# Altium schematic sheet 02.C101. A41-A73. Module signals.SchDoc: Сигнальный кабель
size 209 x 297 mm; Author: Мурашкин Д.В.; Address1: Address1; Address2: Address2; Address3: Address3; Address4: Address4; DocumentNumber: ИЗДЕЛИЕ-1-2; SheetNumber: 3; Scale: 1:1; Letter1Column: Э
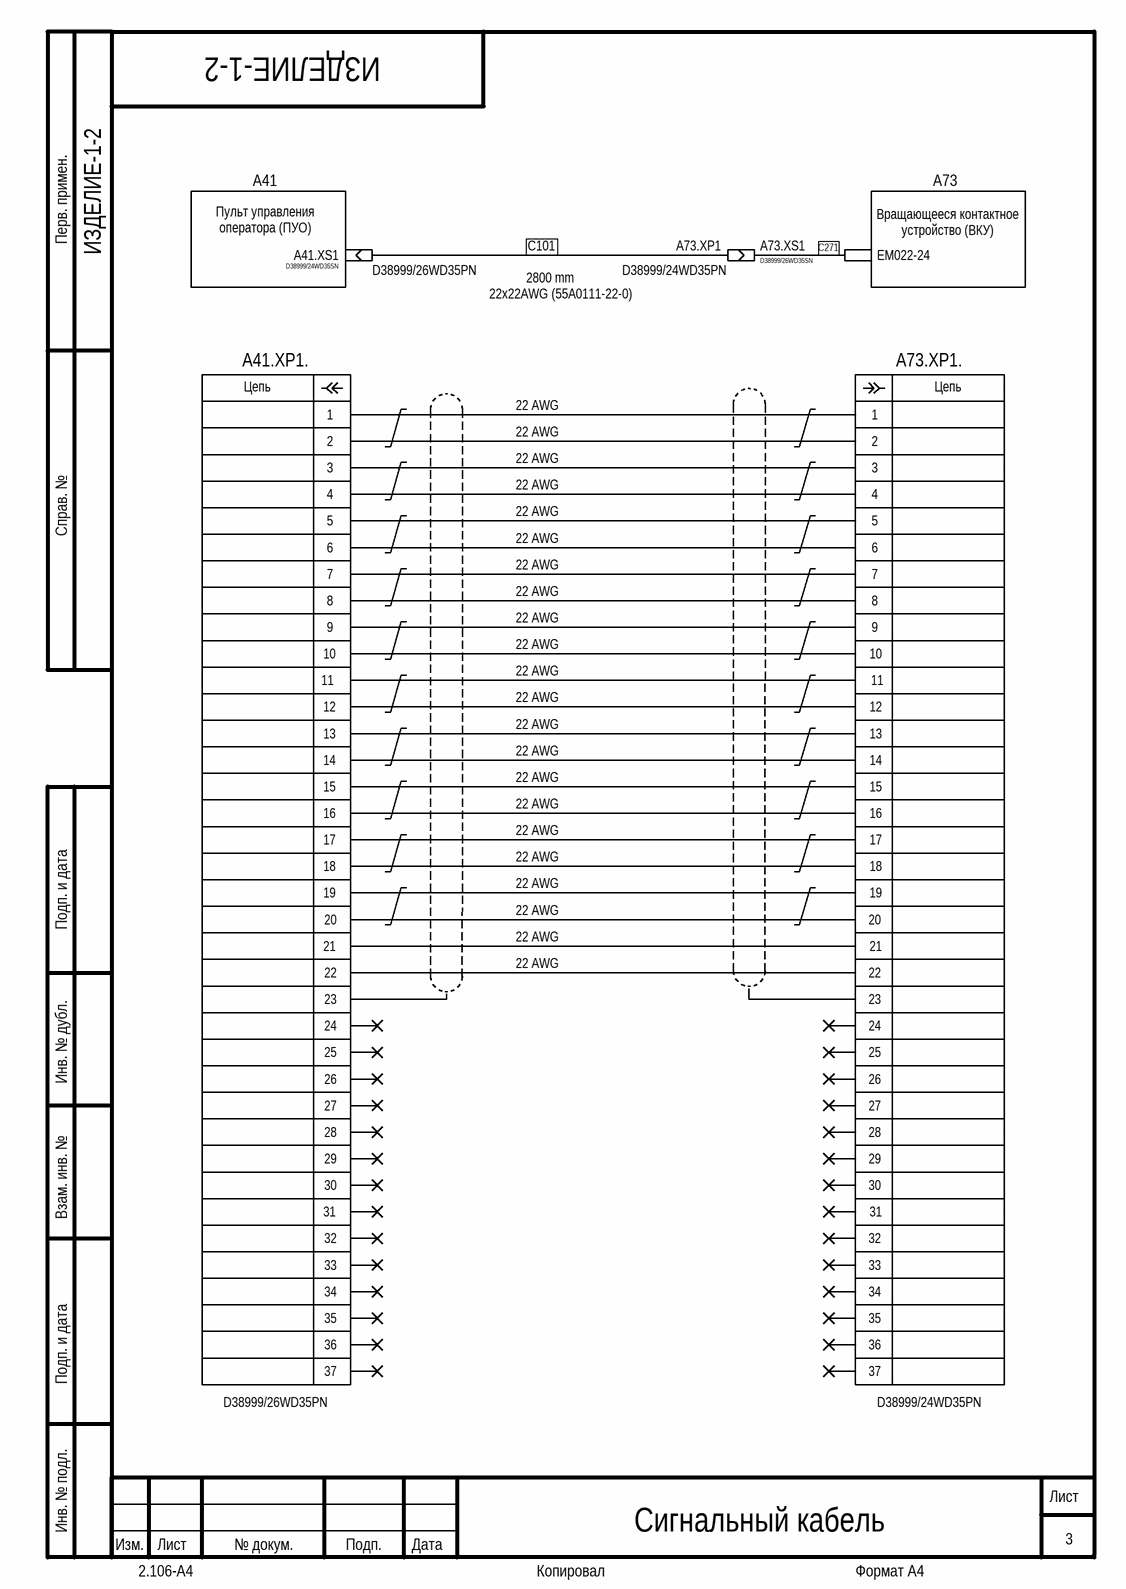
[diagram p0: 02.C101. A41-A73. Module signals.SchDoc]

## Parts
A41.XP1  D38999/26WD35PN
A41.XP1.  D38999/26WD35PN
A41.XS1  D38999/24WD35SN
A73.XP1  D38999/24WD35PN
A73.XP1.  D38999/24WD35PN
A73.XS1  D38999/26WD35SN
EM022-24  Провод  (value not drawn)  (no BOM)

## Nets
С101: A41.XP1.0 A73.XP1.0
С271: A73.XS1.0 EM022-24.0
NetA41.XP1._1: A41.XP1..1 A73.XP1..1
NetA41.XP1._2: A41.XP1..2 A73.XP1..2
NetA41.XP1._3: A41.XP1..3 A73.XP1..3
NetA41.XP1._4: A41.XP1..4 A73.XP1..4
NetA41.XP1._5: A41.XP1..5 A73.XP1..5
NetA41.XP1._6: A41.XP1..6 A73.XP1..6
NetA41.XP1._7: A41.XP1..7 A73.XP1..7
NetA41.XP1._8: A41.XP1..8 A73.XP1..8
NetA41.XP1._9: A41.XP1..9 A73.XP1..9
NetA41.XP1._10: A41.XP1..10 A73.XP1..10
NetA41.XP1._11: A41.XP1..11 A73.XP1..11
NetA41.XP1._12: A41.XP1..12 A73.XP1..12
NetA41.XP1._13: A41.XP1..13 A73.XP1..13
NetA41.XP1._14: A41.XP1..14 A73.XP1..14
NetA41.XP1._15: A41.XP1..15 A73.XP1..15
NetA41.XP1._16: A41.XP1..16 A73.XP1..16
NetA41.XP1._17: A41.XP1..17 A73.XP1..17
NetA41.XP1._18: A41.XP1..18 A73.XP1..18
NetA41.XP1._19: A41.XP1..19 A73.XP1..19
NetA41.XP1._20: A41.XP1..20 A73.XP1..20
NetA41.XP1._21: A41.XP1..21 A73.XP1..21
NetA41.XP1._22: A41.XP1..22 A73.XP1..22

Not connected (* = marked no-connect by the designer): A41.XP1. 23 24* 25* 26* 27* 28* 29* 30* 31* 32* 33* 34* 35* 36* 37*; A41.XS1 0; A73.XP1. 23 24* 25* 26* 27* 28* 29* 30* 31* 32* 33* 34* 35* 36* 37*

## Notes on the sheet
- A41
- A73
- (near A41.XS1) Пульт управления оператора (ПУО)
- (near EM022-24) Вращающееся контактное устройство (ВКУ)
- 22x22AWG (55A0111-22-0)
- 2800 mm
- 22 AWG
- Перв. примен.
- Справ. №
- Подп. и дата
- Инв. № дубл.
- Взам. инв. №
- Инв. № подл.
- Изм.
- Лист
- № докум.
- Подп.
- Дата
- 2.106-A4
- Копировал
- Формат А4
- (in symbol Connector signal P37 MIL) Цепь

## Library data of the parts
A41.XP1 A73.XP1 = Connector cable plug: Operating temperature: -°C +°C; Mounting type: Surface mount; Dimension: .0mm x .0mm; Height: .0mm
  A41.XP1: Part name: D38999/26WD35PN
  A73.XP1: Part name: D38999/24WD35PN
A41.XP1. A73.XP1. = Connector signal P37 MIL: P37 MIL; Operating temperature: -°C +°C; Mounting type: Surface mount; Dimension: .0mm x .0mm; Height: .0mm
  A41.XP1.: Part name: D38999/26WD35PN
  A73.XP1.: Part name: D38999/24WD35PN
A41.XS1 A73.XS1 = Connector cable socket: Operating temperature: -°C +°C; Mounting type: Surface mount; Dimension: .0mm x .0mm; Height: .0mm
  A41.XS1: Part name: D38999/24WD35SN
  A73.XS1: Part name: D38999/26WD35SN
EM022-24 = Connector cable coupling: Operating temperature: -°C +°C; Mounting type: Surface mount; Dimension: .0mm x .0mm; Height: .0mm